# Altium schematic sheet Stepper-Driver.SchDoc
size A4; SheetNumber: 5
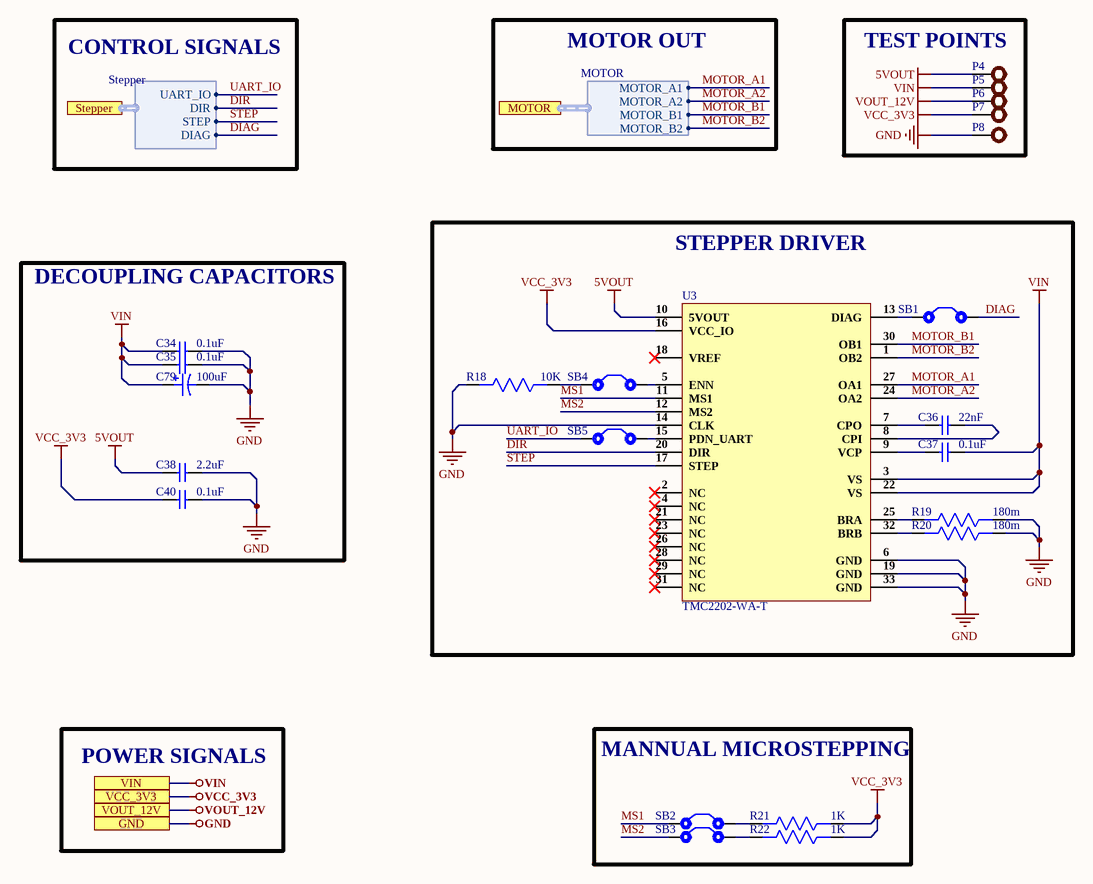
[diagram p0: Stepper-Driver.SchDoc]

## Parts
C34  0.1uF  [Cap0603]
C35  0.1uF  [Cap0603]
C36  22nF  [Cap0603]
C37  0.1uF  [Cap0603]
C38  2.2uF  [Cap0603]
C40  0.1uF  [Cap0603]
C79  100uF  [VKMD1001J101MV]
P4  Test Point  [TEST POINT]  (value not drawn)
P5  Test Point  [TEST POINT]  (value not drawn)
P6  Test Point  [TEST POINT]  (value not drawn)
P7  Test Point  [TEST POINT]  (value not drawn)
P8  Test Point  [TEST POINT]  (value not drawn)
R18  10K  [Res0603]
R19  180m  [RES 2512]
R20  180m  [RES 2512]
R21  1K  [Res0603]
R22  1K  [Res0603]
SB1  Solder Bridge  [Solder Bridge]  (value not drawn)
SB2  Solder Bridge  [Solder Bridge]  (value not drawn)
SB3  Solder Bridge  [Solder Bridge]  (value not drawn)
SB4  Solder Bridge  [Solder Bridge]  (value not drawn)
SB5  Solder Bridge  [Solder Bridge]  (value not drawn)
U3  TMC2202-WA-T  [32-QFN (5x5)]

## Blocks framed on the sheet
TEST POINTS: P4-P8
STEPPER DRIVER: C36 C37 R18-R20 SB1 SB4 SB5 U3
DECOUPLING CAPACITORS: C34 C35 C38 C40 C79
MANNUAL MICROSTEPPING: R21 R22 SB2 SB3

## Ports
GND, MOTOR (harness MOTOR), Stepper (harness Stepper), VCC_3V3, VIN, VOUT_12V

## Harnesses
Stepper: UART_IO, DIR, STEP, DIAG
MOTOR: MOTOR_A1, MOTOR_A2, MOTOR_B1, MOTOR_B2

## Nets
5VOUT: C38.1 P4.1 U3.10(5VOUT)
GND: C34.2 C35.2 C38.2 C40.2 C79.2 P8.1 R18.2 R19.1 R20.1 U3.6(GND) U3.14(CLK) U3.19(GND) U3.33(GND) ; port GND
VCC_3V3: C40.1 P7.1 R21.1 R22.1 U3.16(VCC_IO) ; port VCC_3V3
VIN: C34.1 C35.1 C37.2 C79.1 P5.1 U3.3(VS) U3.22(VS) ; port VIN
VOUT_12V: P6.1 ; port VOUT_12V
DIAG: SB1.2 ; port Stepper.DIAG
DIR: U3.20(DIR) ; port Stepper.DIR
MOTOR_A1: U3.27(OA1) ; port MOTOR.MOTOR_A1
MOTOR_A2: U3.24(OA2) ; port MOTOR.MOTOR_A2
MOTOR_B1: U3.30(OB1) ; port MOTOR.MOTOR_B1
MOTOR_B2: U3.1(OB2) ; port MOTOR.MOTOR_B2
MS1: SB2.1 U3.11(MS1)
MS2: SB3.1 U3.12(MS2)
STEP: U3.17(STEP) ; port Stepper.STEP
UART_IO: SB5.1 ; port Stepper.UART_IO
NetC36_1: C36.1 U3.7(CPO)
NetC36_2: C36.2 U3.8(CPI)
NetC37_1: C37.1 U3.9(VCP)
NetR18_1: R18.1 SB4.1
NetR19_2: R19.2 U3.25(BRA)
NetR20_2: R20.2 U3.32(BRB)
NetR21_2: R21.2 SB2.2
NetR22_2: R22.2 SB3.2
NetSB1_1: SB1.1 U3.13(DIAG)
NetSB4_2: SB4.2 U3.5(ENN)
NetSB5_2: SB5.2 U3.15(PDN_UART)

Not connected (* = marked no-connect by the designer): U3 2(NC)* 4(NC)* 18(VREF)* 21(NC)* 23(NC)* 26(NC)* 28(NC)* 29(NC)* 31(NC)*

## Notes on the sheet
- MOTOR OUT
- CONTROL SIGNALS
- POWER SIGNALS

## Library data of the parts
C34 C35 C37 C40 = CC0603KRX7R0BB104: CAP CER 0.1UF 100V X7R 0603; Manufacturer: Yageo; Capacitance: 100nF; Tolerance: 10%; Supplier 1: Digi-Key; Manufacturer Part Number: CC0603KRX7R0BB104; RoHS: Yes; Category: Ceramic Capacitors; Stock 1: 60476; Pricing 1: 1=0.19000, 10=0.13500, 50=0.07680, 100=0.06370, 500=0.04466, 1000=0.03696 (USD); Mount: Surface Mount; Case/Package: 0603; Case Code (Metric): 1608; Case Code (Imperial): 0603; Weight: 7.1E-05oz; Min Operating Temperature: -55°C; Max Operating Temperature: 125°C; Package Quantity: 4000; Voltage Rating: 100V; Packaging: Tape and Reel; Dielectric: X7R; Termination: SMD/SMT; Resistor Type: Ceramic; Voltage Rating (DC): 100V; Series: CC; Length: 0.063inch; Width: 0.031inch; Thickness: 0.035inch; Depth: 0.8mm; Lead Free: Lead Free; RoHS Compliant: Yes; ComponentLink1URL: https://datasheet.ciiva.com/6277/mlccorderingcode-6277030.pdf?src-supplier=Digi-Key; ComponentLink1Description: https://datasheet.ciiva.com/6277/mlccorderingcode-6277030.pdf?src-supplier=Digi-Key; ComponentLink2URL: https://datasheet.ciiva.com/6277/mlccorderingcode-6277081.pdf?src-supplier=Digi-Key; ComponentLink2Description: https://datasheet.ciiva.com/6277/mlccorderingcode-6277081.pdf?src-supplier=Digi-Key; ComponentLink3URL: https://datasheet.ciiva.com/6277/mlccorderingcode-6277082.pdf?src-supplier=Digi-Key; ComponentLink3Description: https://datasheet.ciiva.com/6277/mlccorderingcode-6277082.pdf?src-supplier=Digi-Key; Supplier Part Number 1: 311-1523-1-ND
C36 = CGA3E2X7R2A223K080AA: CAP CER 0.022UF 100V X7R 0603; Manufacturer: TDK; Tolerance: 10%; Supplier 1: Digi-Key; Manufacturer Part Number: CGA3E2X7R2A223K080AA; RoHS: Yes; Category: Ceramic Capacitors; Stock 1: 56079; Pricing 1: 1=0.11000, 10=0.07600, 50=0.04340, 100=0.03590, 500=0.02516, 1000=0.02083 (USD); Mount: Surface Mount; Case/Package: 0603; Case Code (Metric): 1608; Case Code (Imperial): 0603; Weight: 7.1E-05oz; Min Operating Temperature: -55°C; Max Operating Temperature: 125°C; Capacitance: 22nF; Voltage Rating: 100V; Packaging: Tape and Reel; Voltage Rating (DC): 100V; Dielectric: X7R; Termination: SMD/SMT; Series: CGA; Package Quantity: 1; Resistor Type: Ceramic; Length: 1.6mm; Width: 0.031inch; Height: 0.8mm; Thickness: 0.035inch; Depth: 0.8mm; Ratings: AEC-Q200; RoHS Compliant: Yes; REACH SVHC: No SVHC; ComponentLink1URL: https://datasheet.ciiva.com/22725/1735406-22725648.pdf?src-supplier=Element14; ComponentLink1Description: https://datasheet.ciiva.com/22725/1735406-22725648.pdf?src-supplier=Element14; ComponentLink2URL: https://datasheet.ciiva.com/24218/cga3e2x7r2a223k080aa-266292-24218959.pdf?src-supplier=Mouser; ComponentLink2Description: https://datasheet.ciiva.com/24218/cga3e2x7r2a223k080aa-266292-24218959.pdf?src-supplier=Mouser; ComponentLink3URL: https://datasheet.ciiva.com/7975/1807242-7975349.pdf?src-supplier=Element14; ComponentLink3Description: https://datasheet.ciiva.com/7975/1807242-7975349.pdf?src-supplier=Element14; Supplier Part Number 1: 445-5814-1-ND
C38 = UMK107BBJ225MA-T: CAP CER 2.2UF 50V X5R 0603; Manufacturer: Taiyo Yuden; Supplier 1: Digi-Key; Manufacturer Part Number: UMK107BBJ225MA-T; RoHS: Yes; Category: Ceramic Capacitors; Stock 1: 1; Pricing 1: 1=0.26000, 10=0.18100, 50=0.12060, 100=0.10240, 500=0.07232, 1000=0.06327 (USD); RoHS Compliant: Yes; Supplier Part Number 1: 587-6298-1-ND
C79 = VKMD1001J101MV: 63V 10mm 8mm 100uF ±20% ,8x10mm Aluminum Electrolytic Cap; Manufacturer: Ymin; Manufacturer Part No: VKMD1001J101MV; Value: 100uF; Voltage: 63V; ComponentLink1Description: LCSC; ComponentLink1URL: https://lcsc.com/product-detail/Aluminum-Electrolytic-Capacitors-SMD_Ymin-VKMD1001J101MV_C487384.html
P4-P8 = TEST POINT: Test Point ON
R18 = AC0603JR-0710KL: RES SMD 10K OHM 5% 1/10W 0603; Manufacturer: Yageo; Voltage Rating: 50V; Resistance: 10kR; Power Rating: 100mW; Temperature Coefficient: 100ppm/°C; Supplier 1: Future Electronics; Manufacturer Part Number: AC0603JR-0710KL; RoHS: Yes; Category: Chip SMD Resistors; Stock 1: 1533000; Pricing 1: 5000=0.00540 (USD); Case/Package: 0603; Case Code (Imperial): 0603; Case Code (Metric): 1608; Size Code: 0603; Min Operating Temperature: -55°C; Max Operating Temperature: 155°C; Packaging: Tape and Reel; Tolerance: 5%; Package Quantity: 1; Resistor Type: Thick Film; Termination: SMD/SMT; Number of Terminations: 2; Max Power Dissipation: 100mW; Features: Moisture Resistant,Automotive AEC-Q200,Anti-Sulfur; Series: AC; Construction: Rectangular; Length: 0.063inch; Width: 0.031inch; Height: 0.022inch; Depth: 0.8mm; Military Standard: Not; Lead Free: Lead Free; RoHS Compliant: Yes; ComponentLink1URL: https://datasheet.ciiva.com/5562/pyu-ac-51-rohs-l-2-5562553.pdf?src-supplier=Mouser; ComponentLink1Description: https://datasheet.ciiva.com/5562/pyu-ac-51-rohs-l-2-5562553.pdf?src-supplier=Mouser; Supplier Part Number 1: 1029044
R19 R20 = RTT25R18JTE: RES SMD ±5% ±200ppm/℃ 0.18Ω 1W 2512; Manufacturer: RALEC; Package: 2512; Tolerance: ±5%; Temperature Coefficient: ±200ppm/℃; Resistance: 0.18Ω; Power(Watts): 1W
R21 R22 = RC0603FR-071KL: RES SMD 1K OHM 1% 1/10W 0603; Manufacturer: Yageo; Resistance: 1kR; Temperature Coefficient: 100ppm/°C; Power Rating: 100mW; Voltage Rating: 50V; ComponentLink1URL: https://www.verical.com/server-webapp/html/getDatasheet?partID=409289&src-supplier=Verical; ComponentLink1Description: https://www.verical.com/server-webapp/html/getDatasheet?partID=409289&src-supplier=Verical; Supplier 1: Digi-Key; Manufacturer Part Number: RC0603FR-071KL; Stock 1: 21472395; Pricing 1: 1=0.1, 10=0.023, 100=0.0094, 1000=0.0042, 2500=0.0037 (USD); Case/Package: 0603; Contact Plating: Tin,Matte; Case Code (Imperial): 0603; Case Code (Metric): 1608; Min Operating Temperature: -55°C; Max Operating Temperature: 155°C; Tolerance: 1%; Composition: Thick Film; Packaging: Tape and Reel; Termination: SMD/SMT; Military Standard: Not; Length: 1.6mm; Height: 0.45mm; Depth: 0.8mm; Radiation Hardening: No; REACH SVHC: No SVHC; Lead Free: Lead Free; ComponentLink2URL: http://documents.rs-components.com/techlib://itc_doclist_GB.htm?stockno=5048928&src-supplier=RSComponents; ComponentLink2Description: http://documents.rs-components.com/techlib://itc_doclist_GB.htm?stockno=5048928&src-supplier=RSComponents; ComponentLink3URL: http://www.yageo.com/documents/recent/PYu-RC0603_51_RoHS_L_4.pdf?src-supplier=Avnet+Europe; ComponentLink3Description: http://www.yageo.com/documents/recent/PYu-RC0603_51_RoHS_L_4.pdf?src-supplier=Avnet+Europe; ComponentLink4URL: http://www.farnell.com/datasheets/2167052.pdf?src-supplier=Element14; ComponentLink4Description: http://www.farnell.com/datasheets/2167052.pdf?src-supplier=Element14; ComponentLink5URL: http://www.farnell.com/datasheets/1868787.pdf?src-supplier=Element14; ComponentLink5Description: http://www.farnell.com/datasheets/1868787.pdf?src-supplier=Element14; ComponentLink6URL: http://www.yageo.com/documents/recent/PYu-RC_Group_51_RoHS_L_2.pdf?src-supplier=Avnet; ComponentLink6Description: http://www.yageo.com/documents/recent/PYu-RC_Group_51_RoHS_L_2.pdf?src-supplier=Avnet; ComponentLink7URL: https://www.verical.com/server-webapp/html/getDatasheet?partID=404327&src-supplier=Verical; ComponentLink7Description: https://www.verical.com/server-webapp/html/getDatasheet?partID=404327&src-supplier=Verical; ComponentLink8URL: http://www.farnell.com/datasheets/443971.pdf?src-supplier=Element14; ComponentLink8Description: http://www.farnell.com/datasheets/443971.pdf?src-supplier=Element14; Supplier Part Number 1: 311-1.00KHRDKR-ND
SB1-SB5 = Solder Bridge: Solder Bridge ON
U3 = TMC2202-WA-T: Stepper Motor Driver/Controller, 5V to 36V, 1 to 256 Microsteps, 1.2A, QFN-32; Manufacturer: Trinamic; Logic Function: AND GATE; Interface: UART; Supplier 1: Digi-Key; Manufacturer Part Number: TMC2202-WA-T; Stock 1: 10; Pricing 1: 1=2.46000, 50=2.21000, 100=1.95000, 500=1.69000, 1000=1.63500 (USD); Mount: Surface Mount; Case/Package: QFN; Min Operating Temperature: -40°C; Max Operating Temperature: 125°C; Packaging: Cut Tape; Output Current: 1.2A; ComponentLink1URL: https://www.trinamic.com/fileadmin/assets/Products/ICs_Documents/TMC220x_TMC222x_datasheet_Rev1.05.pdf?src-supplier=Digi-Key; ComponentLink1Description: https://www.trinamic.com/fileadmin/assets/Products/ICs_Documents/TMC220x_TMC222x_datasheet_Rev1.05.pdf?src-supplier=Digi-Key; Supplier Part Number 1: 1460-1272-1-ND